# Altium schematic sheet Top_Sheet.SchDoc
size A4
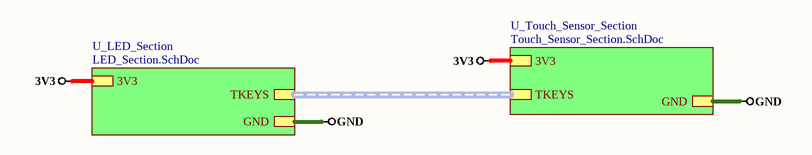
[diagram p0: Top_Sheet.SchDoc]

## Sub-sheets
U_LED_Section = LED_Section.SchDoc: 3V3, GND, TKEYS (harness TKEYS)
U_Touch_Sensor_Section = Touch_Sensor_Section.SchDoc: 3V3, GND, TKEYS (harness TKEYS)

## Nets
3V3: sheet U_Touch_Sensor_Section/3V3, sheet U_LED_Section/3V3
GND: sheet U_Touch_Sensor_Section/GND, sheet U_LED_Section/GND

## Buses and harness runs
harness sheet U_LED_Section/TKEYS = sheet U_Touch_Sensor_Section/TKEYS